# EasyEDA Pro project satelitesbol.eprj, schematic Main Board
Board Name: CDHS; Create Date: 2025-09-11; Page Name: P1; Project Name: satelitesbol; Schematic Name: Main Board; Update Date: 2025-09-24; Company: EasyEDA.com; Page Size: A4; Version: V1.0
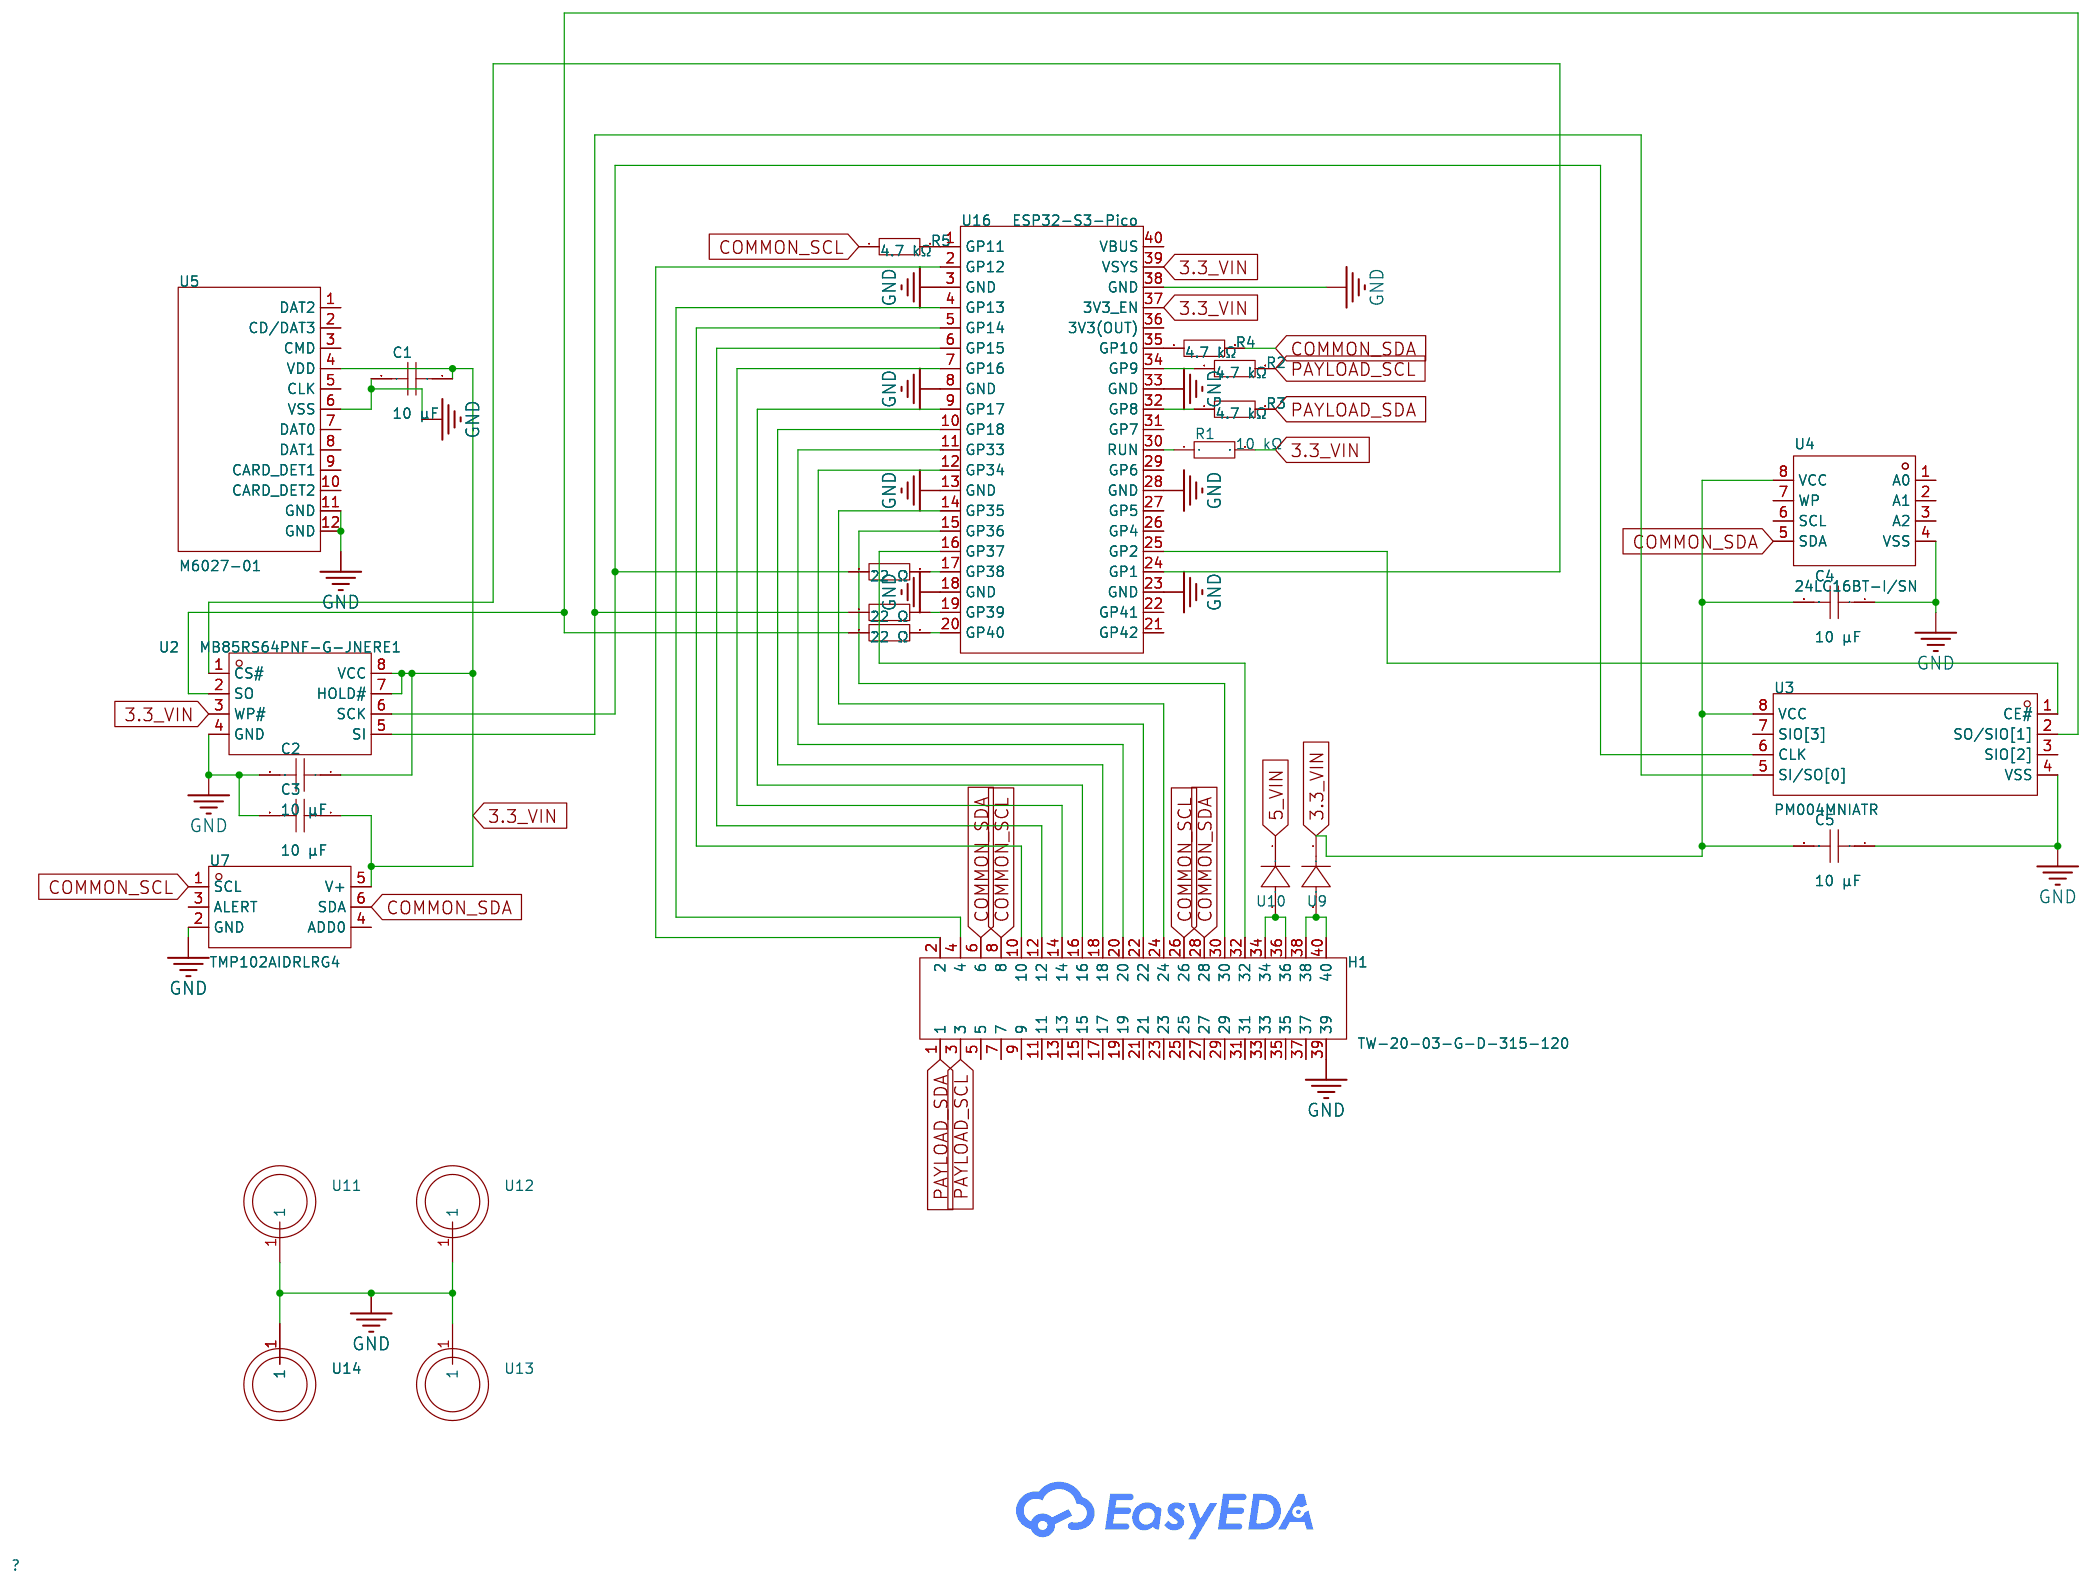
[diagram p3: schematic sheet]

## Parts
C1  10 µF  [C0201]
C2  10 µF  [C0201]
C3  10 µF  [C0201]
C4  10 µF  [C0201]
C5  10 µF  [C0201]
H1  TW-20-03-G-D-315-120  [HDR-TH_40P-P2.00-V-M-R2-C20-S2.00-1]
R1  10 kΩ  [R0603]
R2  10K  [R0603]
R3  10K  [R0603]
R4  10K  [R0603]
R5  10K  [R0603]
R6  10 kΩ  [R0603]
R7  10 kΩ  [R0603]
R8  10 kΩ  [R0603]
U2  MB85RS64PNF-G-JNERE1  [SOIC-8_L4.9-W3.9-P1.27-LS6.0-BL]
U3  PM004MNIATR  [SOP-8_L4.9-W3.9-P1.27-LS6.0-BL]
U4  24LC16BT-I/SN  [SOIC-8_L4.9-W3.9-P1.27-LS6.0-BL]
U5  M6027-01  [TF-SMD_M6027-01]
U7  TMP102AIDRLRG4  [SOT-563_L1.6-W1.2-P0.50-LS1.6-BR]
U9  2CL77  [DIO-TH_BD3.0-L12.0-P16.00-D0.6]
U10  2CL77  [DIO-TH_BD3.0-L12.0-P16.00-D0.6]
U11  -  [M_H]
U12  -  [M_H]
U13  -  [M_H]
U14  -  [M_H]
U16  ESP32-S3-Pico  [LCC-40_L51.0-W21.0-P2.54-BL_RP2040-BASED]

## Library data of the parts
C1-C5 = CAP_0201: Supplier Footprint: 0201
H1 = TW-20-03-G-D-315-120: LCSC Part Name: 间距:2mm 直插; Supplier Part: C7371248; Manufacturer: SAMTEC; Supplier Footprint: 插件,P=2mm; JLCPCB Part Class: Extended Part; Datasheet: https://item.szlcsc.com/datasheet/TW-20-03-G-D-315-120/8342295.html; Supplier: LCSC; Pitch: 2mm; Row Spacing: 2mm; Mounting Type: Through Hole; Number of Rows: 2; Number of Pins: 40P; Contact Plating: Gold; Color: Black
R1-R8 = Res_0603: Supplier Footprint: 0603
U2 = MB85RS64PNF-G-JNERE1: Supplier Part: C8741; Manufacturer: RAMXEED/FUJITSU(富士通); Supplier Footprint: SOP-8; JLCPCB Part Class: Extended Part; Datasheet: https://atta.szlcsc.com/upload/public/pdf/source/20180410/C209966_097C414C6C865B46D6271D36D9BDAAC6.pdf; Supplier: LCSC
U3 = PM004MNIATR: Supplier Part: C5444277; Manufacturer: Siproin(上海矽朋); Supplier Footprint: SOP-8; Datasheet: https://atta.szlcsc.com/upload/public/pdf/source/20230412/571A622A320634CD9B3A3BB9CFEB0AE2.pdf; Supplier: LCSC; Interface: SPI; Memory Format: MRAM; Memory Size: 4Mbit; Voltage - Supply: 2.7V~3.6V; Operating Temperature: -40℃~+85℃
U4 = 24LC16BT-I/SN: Supplier Part: C5456; Manufacturer: MICROCHIP(美国微芯); Supplier Footprint: SOIC-8; JLCPCB Part Class: Extended Part; Datasheet: https://item.szlcsc.com/datasheet/24LC16BT-I%252FSN/5907.html; Supplier: LCSC; Interface: I2C; Memory Size: 16Kbit; Clock Frequency: 400kHz; Voltage - Supply: 2.5V~5.5V; Write Cycle Time(Tw): 5ms; Data Retention - TDR (Year): 200 Year; Write Cycle Endurance: 1,000,000 Cycles; Operating Temperature: -40℃~+85℃
U5 = M6027-01: LCSC Part Name: MicroSD卡(TF卡); Supplier Part: C20624804; Manufacturer: MUP(德海威); Supplier Footprint: SMD; JLCPCB Part Class: Extended Part; Datasheet: https://item.szlcsc.com/datasheet/M6027-01/22027037.html; Supplier: LCSC; Card Type: MicroSD Card (TF Card); Additional Card Detection Pins: Yes
U7 = TMP102AIDRLRG4: Supplier Part: C5987143; Manufacturer: TI(德州仪器); Supplier Footprint: SOT-563; JLCPCB Part Class: Extended Part; Supplier: LCSC
U9 U10 = 2CL77: Supplier Part: C424513; Manufacturer: SUNMATE(森美特); Supplier Footprint: 插件,D3xL12mm; JLCPCB Part Class: Extended Part; Datasheet: https://item.szlcsc.com/datasheet/2CL77/418065.html; Supplier: LCSC; Voltage - Forward(Vf@If): 45V@IF(AV); Voltage - DC Reverse(Vr): 20kV; Current - Rectified: 5mA; Reverse Leakage Current (Ir): 2uA; Non-Repetitive Peak Forward Surge Current: 500mA
U11-U14 = M_H: mounting hole
U16 = ESP32-S3-Pico: LCSC Part Name: ESP32-S3微控制器2.4GHz Wi-Fi开发板240MHz双核处理器; Supplier Part: C18198404; Manufacturer: Waveshare(微雪电子); Datasheet: https://item.szlcsc.com/datasheet/ESP32-S3-Pico/19350072.html; Supplier: LCSC

## Nets
GND: C1.2 C2.2 C3.2 C4.1 C5.1 H1.39 U2.4(GND) U3.4(VSS) U4.4(VSS) U5.6(VSS) U5.11(GND) U5.12(GND) U7.2(GND) U11.1 U12.1 U13.1 U14.1 U16.3(GND) U16.8(GND) U16.13(GND) U16.18(GND) U16.23(GND) U16.28(GND) U16.33(GND) U16.38(GND)
3.3_VIN: C1.1 C2.1 C3.1 C4.2 C5.2 R1.2 U2.3(WP#) U2.7(HOLD#) U2.8(VCC) U3.8(VCC) U4.8(VCC) U5.4(VDD) U7.5(V+) U9.1(K) U16.37(3V3_EN) U16.39(VSYS)
5_VIN: U10.1(K)
COMMON_SCL: H1.8 H1.26 R5.1 U7.1(SCL)
COMMON_SDA: H1.6 H1.28 R4.2 U4.5(SDA) U7.6(SDA)
PAYLOAD_SCL: H1.3 R2.1 R2.2 U16.34(GP9)
PAYLOAD_SDA: H1.1 R3.1 R3.2 U16.32(GP8)
$1N3249: H1.34 H1.36 U10.2(A)
$1N4741: H1.38 H1.40 U9.2(A)
$1N5404: R1.1 U16.30(RUN)
$1N6032: R4.1 U16.35(GP10)
$1N6082: R5.2 U16.1(GP11)
$1N6117: H1.2 U16.2(GP12)
$1N6123: H1.4 U16.4(GP13)
$1N6159: H1.10 U16.5(GP14)
$1N6169: H1.12 U16.6(GP15)
$1N6181: H1.14 U16.7(GP16)
$1N6188: H1.16 U16.9(GP17)
$1N6199: H1.18 U16.10(GP18)
$1N6206: H1.20 U16.11(GP33)
$1N6217: H1.22 U16.12(GP34)
$1N6224: H1.24 U16.14(GP35)
$1N6261: H1.30 U16.15(GP36)
$1N6270: H1.32 U16.16(GP37)
$1N6332: R6.2 U16.17(GP38)
$1N6341: R6.1 U2.6(SCK) U3.6(CLK)
$1N6394: R7.2 U16.19(GP39)
$1N6401: R7.1 U2.5(SI) U3.5(SI/SO[0])
$1N6505: U3.1(CE#) U16.25(GP2)
$1N6527: U2.1(CS#) U16.24(GP1)
$1N6592: R8.1 U2.2(SO) U3.2(SO/SIO[1])
$1N6595: R8.2 U16.20(GP40)

Not connected (* = marked no-connect by the designer): H1 5 7 9 11 13 15 17 19 21 23 25 27 29 31 33 35 37; U3 3(SIO[2]) 7(SIO[3]); U4 1(A0) 2(A1) 3(A2) 6(SCL) 7(WP); U5 1(DAT2) 2(CD/DAT3) 3(CMD) 5(CLK) 7(DAT0) 8(DAT1) 9(CARD_DET1) 10(CARD_DET2); U7 3(ALERT) 4(ADD0); U16 21(GP42) 22(GP41) 26(GP4) 27(GP5) 29(GP6) 31(GP7) 36(3V3(OUT)) 40(VBUS)
